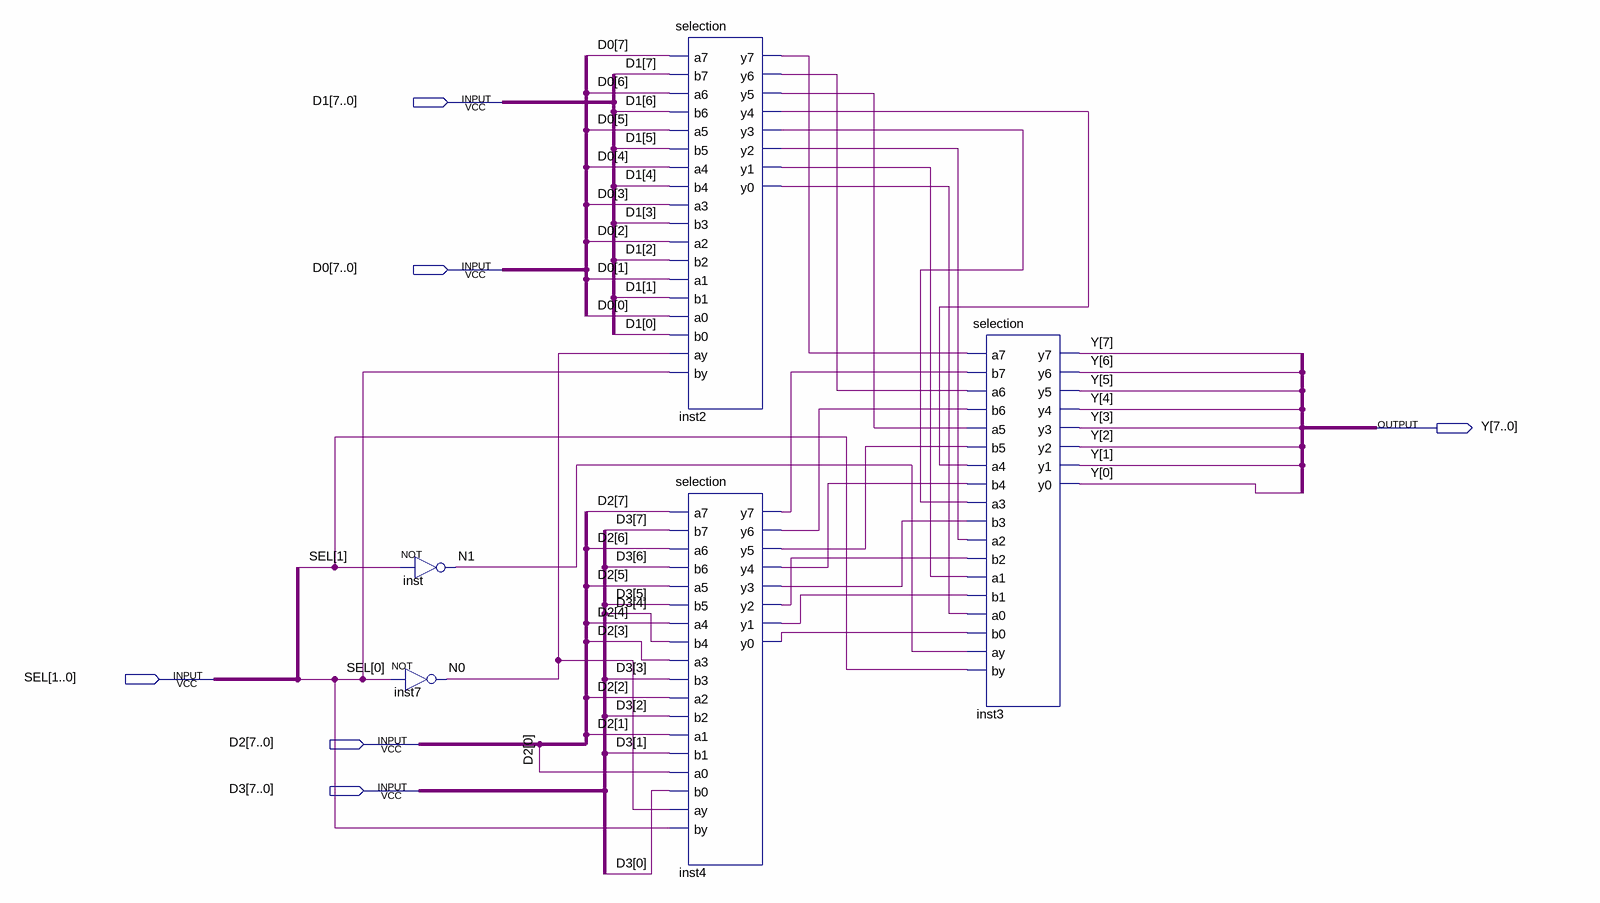
[diagram p0: schematic sheet]
// Quartus schematic select1_from_4_hxgdly.bdf as structural Verilog: 5 symbols, 6 pins
module select1_from_4_hxgdly (
  input  [7:0] D1,
  input  [7:0] D0,
  input  [1:0] SEL,
  input  [7:0] D2,
  input  [7:0] D3,
  output [7:0] Y
);

  wire inst2_y0, inst2_y1, inst2_y2, inst2_y3, inst2_y4, inst2_y5, inst2_y6, inst2_y7, inst4_y0, inst4_y1,
       inst4_y2, inst4_y3, inst4_y4, inst4_y5, inst4_y6, inst4_y7, N0, N1;

  not inst (N1, SEL[1]);
  not inst7 (N0, SEL[0]);
  selection inst2 (
    .a7(D0[7]), .b7(D1[7]), .a6(D0[6]), .b6(D1[6]), .a5(D0[5]), .b5(D1[5]), .a4(D0[4]), .b4(D1[4]),
    .a3(D0[3]), .b3(D1[3]), .a2(D0[2]), .b2(D1[2]), .a1(D0[1]), .b1(D1[1]), .a0(D0[0]), .b0(D1[0]), .ay(N0),
    .by(SEL[0]), .y7(inst2_y7), .y6(inst2_y6), .y5(inst2_y5), .y4(inst2_y4), .y3(inst2_y3), .y2(inst2_y2),
    .y1(inst2_y1), .y0(inst2_y0));
  selection inst4 (
    .a7(D2[7]), .b7(D3[7]), .a6(D2[6]), .b6(D3[6]), .a5(D2[5]), .b5(D3[5]), .a4(D2[4]), .b4(D3[4]),
    .a3(D2[3]), .b3(D3[3]), .a2(D2[2]), .b2(D3[2]), .a1(D2[1]), .b1(D3[1]), .a0(D2[0]), .b0(D3[0]), .ay(N0),
    .by(SEL[0]), .y7(inst4_y7), .y6(inst4_y6), .y5(inst4_y5), .y4(inst4_y4), .y3(inst4_y3), .y2(inst4_y2),
    .y1(inst4_y1), .y0(inst4_y0));
  selection inst3 (
    .a7(inst2_y7), .b7(inst4_y7), .a6(inst2_y6), .b6(inst4_y6), .a5(inst2_y5), .b5(inst4_y5), .a4(inst2_y4),
    .b4(inst4_y4), .a3(inst2_y3), .b3(inst4_y3), .a2(inst2_y2), .b2(inst4_y2), .a1(inst2_y1), .b1(inst4_y1),
    .a0(inst2_y0), .b0(inst4_y0), .ay(N1), .by(SEL[1]), .y7(Y[7]), .y6(Y[6]), .y5(Y[5]), .y4(Y[4]),
    .y3(Y[3]), .y2(Y[2]), .y1(Y[1]), .y0(Y[0]));
endmodule
